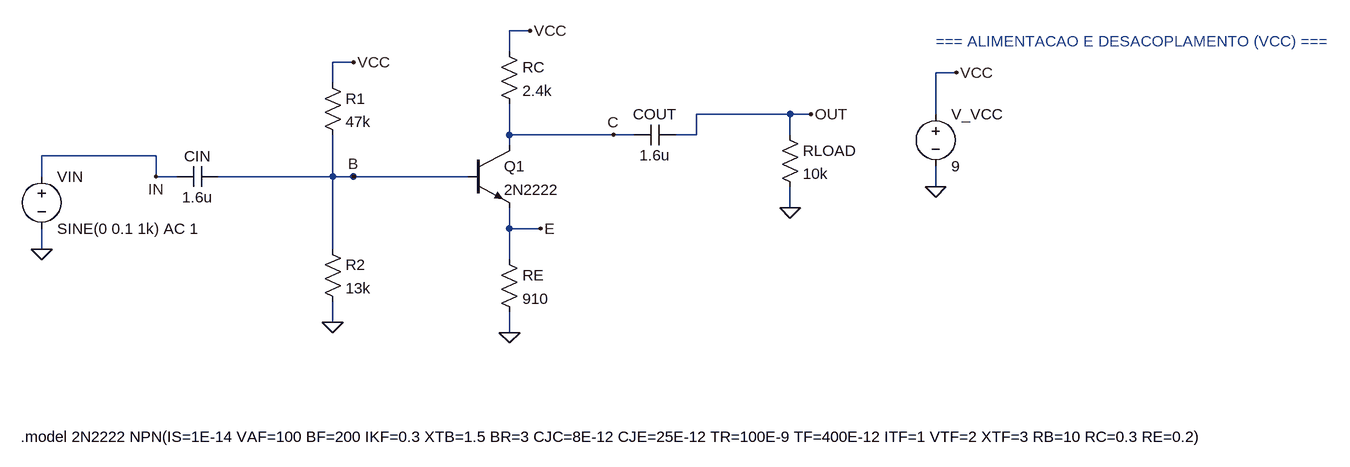
[diagram p0: schematic demo3_reconstructed_from_photo.asc]
demo3_reconstructed_from_photo.asc, the LTspice schematic file:
Version 4
SHEET 1 2592 1280
WIRE 96 368 96 400
WIRE 304 288 272 288
WIRE 368 288 400 288
WIRE 544 144 544 112
WIRE 544 112 576 112
WIRE 544 224 544 400
WIRE 544 288 576 288
WIRE 544 480 544 512
WIRE 752 288 720 288
WIRE 816 96 816 64
WIRE 816 64 848 64
WIRE 816 176 816 240
WIRE 816 224 864 224
WIRE 816 336 816 416
WIRE 816 368 864 368
WIRE 816 496 816 528
WIRE 1008 224 976 224
WIRE 1072 224 1104 224
WIRE 1248 224 1248 192
WIRE 1248 192 1280 192
WIRE 1248 304 1248 336
WIRE 1472 192 1472 128
WIRE 1472 272 1472 304
WIRE 1472 128 1504 128
WIRE 96 288 96 256
WIRE 96 256 128 256
WIRE 864 224 976 224
WIRE 128 256 272 256
WIRE 272 256 272 288
WIRE 1104 224 1104 192
WIRE 1104 192 1280 192
WIRE 400 288 576 288
WIRE 576 288 720 288
FLAG 96 400 0
FLAG 272 288 IN
FLAG 576 112 VCC
FLAG 576 288 B
FLAG 544 512 0
FLAG 848 64 VCC
FLAG 864 368 E
FLAG 816 528 0
FLAG 976 224 C
FLAG 1280 192 OUT
FLAG 1248 336 0
FLAG 1472 304 0
FLAG 1504 128 VCC
SYMBOL voltage 96 272 R0
WINDOW 3 24 96 Left 2
SYMATTR InstName VIN
SYMATTR Value SINE(0 0.1 1k) AC 1
SYMBOL cap 368 272 R90
WINDOW 0 0 32 VBottom 2
WINDOW 3 32 32 VTop 2
SYMATTR InstName CIN
SYMATTR Value 1.6u
SYMBOL res 528 128 R0
SYMATTR InstName R1
SYMATTR Value 47k
SYMBOL res 528 384 R0
SYMATTR InstName R2
SYMATTR Value 13k
SYMBOL npn 752 240 R0
SYMATTR InstName Q1
SYMATTR Value 2N2222
SYMBOL res 800 80 R0
SYMATTR InstName RC
SYMATTR Value 2.4k
SYMBOL res 800 400 R0
SYMATTR InstName RE
SYMATTR Value 910
SYMBOL cap 1072 208 R90
WINDOW 0 0 32 VBottom 2
WINDOW 3 32 32 VTop 2
SYMATTR InstName COUT
SYMATTR Value 1.6u
SYMBOL res 1232 208 R0
SYMATTR InstName RLOAD
SYMATTR Value 10k
SYMBOL voltage 1472 176 R0
WINDOW 3 24 96 Left 2
SYMATTR InstName V_VCC
SYMATTR Value 9
TEXT 1472 80 Left 2 ;=== ALIMENTACAO E DESACOPLAMENTO (VCC) ===
TEXT 64 688 Left 2 !.model 2N2222 NPN(IS=1E-14 VAF=100 BF=200 IKF=0.3 XTB=1.5 BR=3 CJC=8E-12 CJE=25E-12 TR=100E-9 TF=400E-12 ITF=1 VTF=2 XTF=3 RB=10 RC=0.3 RE=0.2)

The netlist it stands for:
* demo3_reconstructed_from_photo.asc
VIN IN 0 SINE(0 0.1 1k) AC 1
CIN B IN 1.6u
R1 VCC B 47k
R2 B 0 13k
Q1 C B E 0 2N2222
RC VCC C 2.4k
RE E 0 910
COUT OUT C 1.6u
RLOAD OUT 0 10k
V_VCC VCC 0 9
.model NPN NPN
.model PNP PNP
.lib standard.bjt
* === ALIMENTACAO E DESACOPLAMENTO (VCC) ===
.model 2N2222 NPN(IS=1E-14 VAF=100 BF=200 IKF=0.3 XTB=1.5 BR=3 CJC=8E-12 CJE=25E-12 TR=100E-9 TF=400E-12 ITF=1 VTF=2 XTF=3 RB=10 RC=0.3 RE=0.2)
.backanno
.end